# Altium schematic sheet Sheet1.SchDoc
size A; SheetNumber: 1; SheetTotal: 1
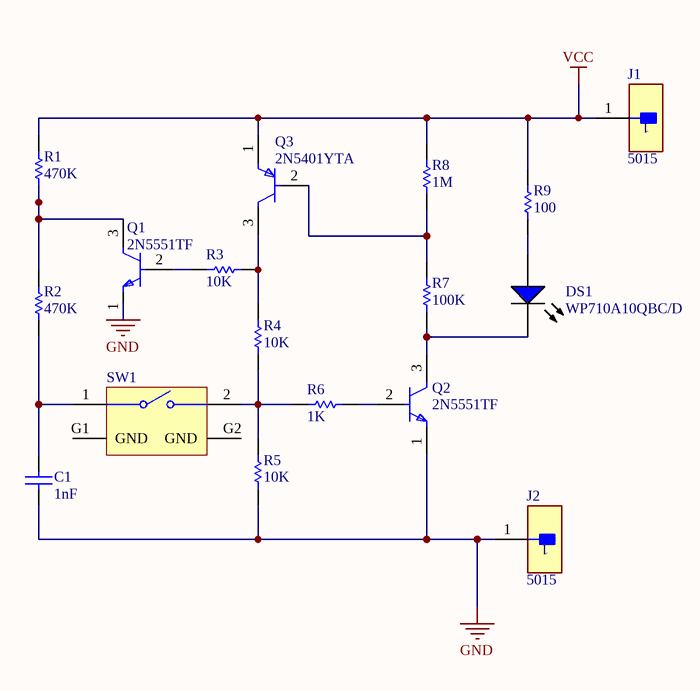
[diagram p0: Sheet1.SchDoc]

## Parts
C1  value 1nF  [CAP]  (hidden comment: Cap)
DS1  WP710A10QBC/D  [KING-WP710A10QBCD_V]
J1  5015  [FP-5015-MFG]
J2  5015  [FP-5015-MFG]
Q1  2N5551TF  [FP-135AR-MFG]
Q2  2N5551TF  [FP-135AR-MFG]
Q3  2N5401YTA  [FP-135AR-MFG]
R1  value 470K  [AXIAL-0.3]  (hidden comment: Res1)
R2  value 470K  [AXIAL-0.3]  (hidden comment: Res1)
R3  value 10K  [AXIAL-0.3]  (hidden comment: Res1)
R4  value 10K  [AXIAL-0.3]  (hidden comment: Res1)
R5  value 10K  [AXIAL-0.3]  (hidden comment: Res1)
R6  value 1K  [AXIAL-0.3]  (hidden comment: Res1)
R7  value 100K  [AXIAL-0.3]  (hidden comment: Res1)
R8  value 1M  [AXIAL-0.3]  (hidden comment: Res1)
R9  value 100  [AXIAL-0.3]  (hidden comment: Res1)
SW1  431256058716  [4312560587x6]  (value not drawn)

## Nets
GND: C1.1 J2.1 Q1.1(E) Q2.1(E) R5.2
VCC: J1.1 Q3.1(E) R1.2 R8.1 R9.1
NetC1_2: C1.2 R2.2 SW1.1
NetDS1_1: DS1.1(A) R9.2
NetDS1_2: DS1.2(K) Q2.3(C) R7.2
NetQ1_2: Q1.2(B) R3.1
NetQ1_3: Q1.3(C) R1.1 R2.1
NetQ2_2: Q2.2(B) R6.2
NetQ3_2: Q3.2(B) R7.1 R8.2
NetQ3_3: Q3.3(C) R3.2 R4.1
NetR4_2: R4.2 R5.1 R6.1 SW1.2

Not connected (* = marked no-connect by the designer): SW1 G1(GND) G2(GND)

## Library data of the parts
C1 = Cap: Capacitor; Published: 8-Jun-2000; LatestRevisionDate: 17-Jul-2002; LatestRevisionNote: Re-released for DXP Platform.; PackageReference: RAD-0.3; Publisher: Altium Limited; PackageDescription: Radial Cap, Thru-Hole; 2 Leads; 0.3 in Pin Spacing
DS1 = CMP-2000-07416-1: Blue LED, 3.3 V, 20 mA, -40 to 85 degC, 2-Pin THD, RoHS, Bulk; Manufacturer: Kingbright; Forward Current: 20mA; LED Size: T-1; Viewing Angle: 20deg; Lens Color/Style: WaterClear; Wavelength/Color Temperature: 470nm; Forward Voltage: 3.3V; Luminous Intensity: 1600mcd; Lens Shape: Dome; Type: SolidStateLEDLamp; Minimum Operating Temperature: -40C; Package Description: 2-Pin Through Hole Device, Dia 3.2 mm; Packaging: Bulk; Maximum Operating Temperature: +85C; Factory Pack Quantity: 500; Mounting Technology: ThroughHole; Datasheet URL: https://datasheet.ciiva.com/2121/wp710a10qbc-d-2121617.pdf; Datasheet Version: Rev. 5B, 09/2014; Package Reference: WP710A10QBCD; Lens Dimensions: 3mmx4.6mm; Product Category: StandardLEDs-ThroughHole; Manufacturer URL: http://www.kingbright.com/; Mounting Style: ThroughHole; RoHS: Details; Illumination Color: Blue
J1 J2 = CMP-2000-05183-2: PC TEST POINT MINIATURE; Manufacturer: keystone; Number Of Contacts: 1; Conn Orientation: Straight; Category: Conn; Manufacturer Part Number: 5015; Digikey Description: PC TEST POINT MINIATURE; Automotive: No; Lead Free: Yes; Octopart: https://octopart.com/5015-keystone-3822; ComponentLink2URL: http://www.keyelco.com/product-pdf.cfm?p=1353; Package: 5015; RoHS: TRUE; Device Class L3: unset; Device Class L2: unset; Contact Material: Silver; Device Class L1: Connectors; Height: 1.65mm; ComponentLink2Description: Datasheet
Q1 Q2 = CMP-00278-84408890-1: 2N5551TF Small Signal Bipolar Transistor, 0.6A I(C), 160V V(BR)CEO, 1-Element, NPN, Silicon, TO-92; Manufacturer Lifecycle Status: ACTIVE; Max Power Dissipation: 625mW; Collector Base Voltage (VCBO): 180V; Emitter Base Voltage (VEBO): 6V; hFE Min: 80; Current Rating: 600mA; Number of Elements: 1; Element Configuration: Single; Max Junction Temperature (Tj): 150°C; Frequency: 300MHz; Transition Frequency: 100MHz; Collector Emitter Saturation Voltage: 200mV; Max Operating Temperature: 150°C; Number of Pins: 3; Polarity: NPN; Schedule B: 8541210080, 8541210080|8541210080|8541210080|8541210080|8541210080; Width: 4.19mm; Lead Free: Lead Free; Min Operating Temperature: -55°C; Contact Plating: Tin; Max Frequency: 300MHz; Height: 8.77mm; Voltage Rating (DC): 160V; Power Dissipation: 625mW; Radiation Hardening: No; Weight: 240mg; Max Breakdown Voltage: 160V; Gain Bandwidth Product: 100MHz; Case/Package: TO-92-3; Lifecycle Status: Production; Collector Emitter Voltage (VCEO): 160V; RoHS: Compliant; Length: 5.2mm; Mount: Through Hole; Max Collector Current: 600mA; Collector Emitter Breakdown Voltage: 160V
Q3 = CMP-00278-84793548-1: 2N5401YTA Bipolar (BJT) Transistor PNP 150 V 600 mA 400MHz 625 mW Through Hole TO-92-3; Manufacturer Lifecycle Status: ACTIVE; Voltage Rating (DC): -160V; Number of Elements: 1; Collector Emitter Breakdown Voltage: 150V; Max Collector Current: 600mA; Collector Base Voltage (VCBO): 160V; Emitter Base Voltage (VEBO): 5V; Current Rating: -600mA; Power Dissipation: 625mW; Element Configuration: Single; Case/Package: TO-92-3; Min Operating Temperature: -55°C; Lead Free: Lead Free; Transition Frequency: 400MHz; Collector Emitter Voltage (VCEO): 150V; NexarPartId: 84793548; Weight: 240mg; Frequency: 400MHz; RoHS: Compliant; Lifecycle Status: Production; Schedule B: 8541210080; Number of Pins: 3; Max Operating Temperature: 150°C; Mount: Through Hole; Polarity: PNP; Max Power Dissipation: 625mW; Gain Bandwidth Product: 400MHz
R1-R9 = Res1: Resistor; Published: 8-Jun-2000; LatestRevisionDate: 17-Jul-2002; LatestRevisionNote: Re-released for DXP Platform.; PackageReference: AXIAL-0.3; Publisher: Altium Limited; PackageDescription: Axial Device, Thru-Hole; 2 Leads; 0.3 in Pin Spacing
SW1 = CMP-1458-00007-4: Tactile Switch, 0.05A, 12Vdc, 160Gf, Tht Rohs Compliant: Yes |Wurth Elektronik 431256058716; Illumination Type: Non-Illuminated; Voltage Rating: 12V; Insulation Resistance: 100MΩ; Switch Function: Off-Mom; Throw Configuration: SPST; Actuator Material: Liquid Crystal Polymer, Polymer; Current Rating: 50mA; Switch Travel: 250µm; Mechanical Life: 200kcycles; Diameter: 3mm; Packaging: Bulk; RoHS: Compliant; Min Operating Temperature: -40°C; Termination: PC Pin; Contact Plating: Silver; Max Operating Temperature: 85°C; Height: 5.85mm